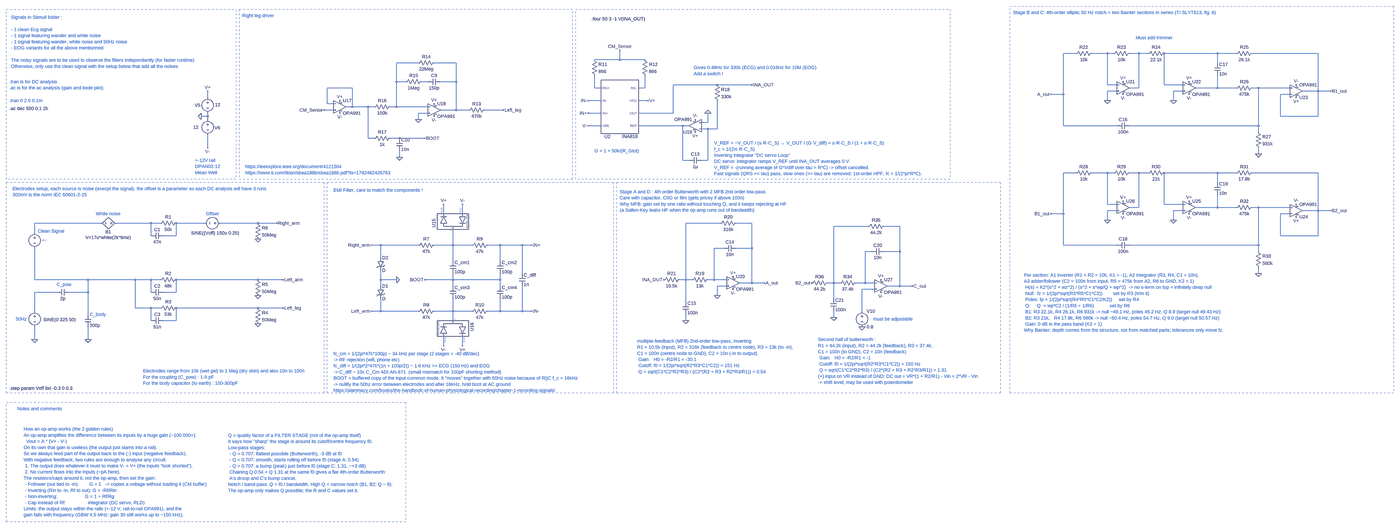
[diagram p0: schematic ECG-EOG_project.asc, whole sheet]
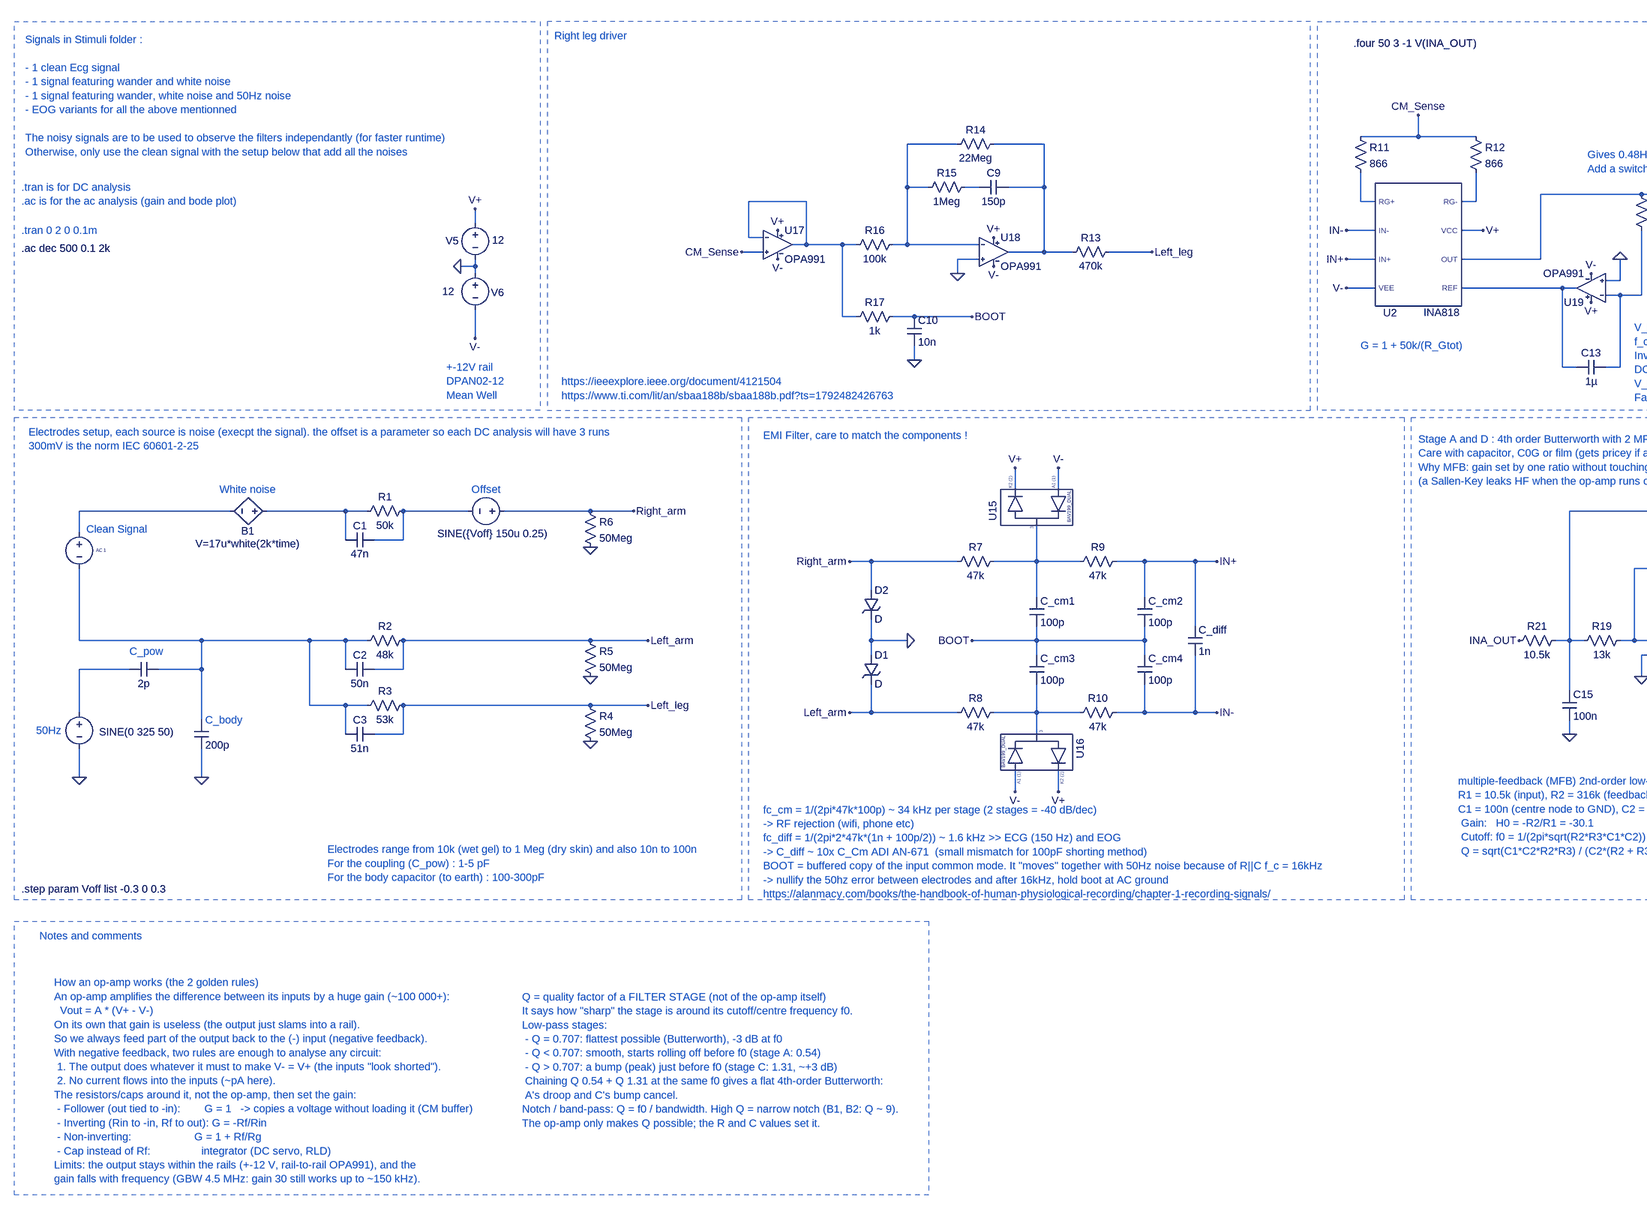
[diagram p1: schematic ECG-EOG_project.asc, part, row 1 of 1, column 1 of 2]
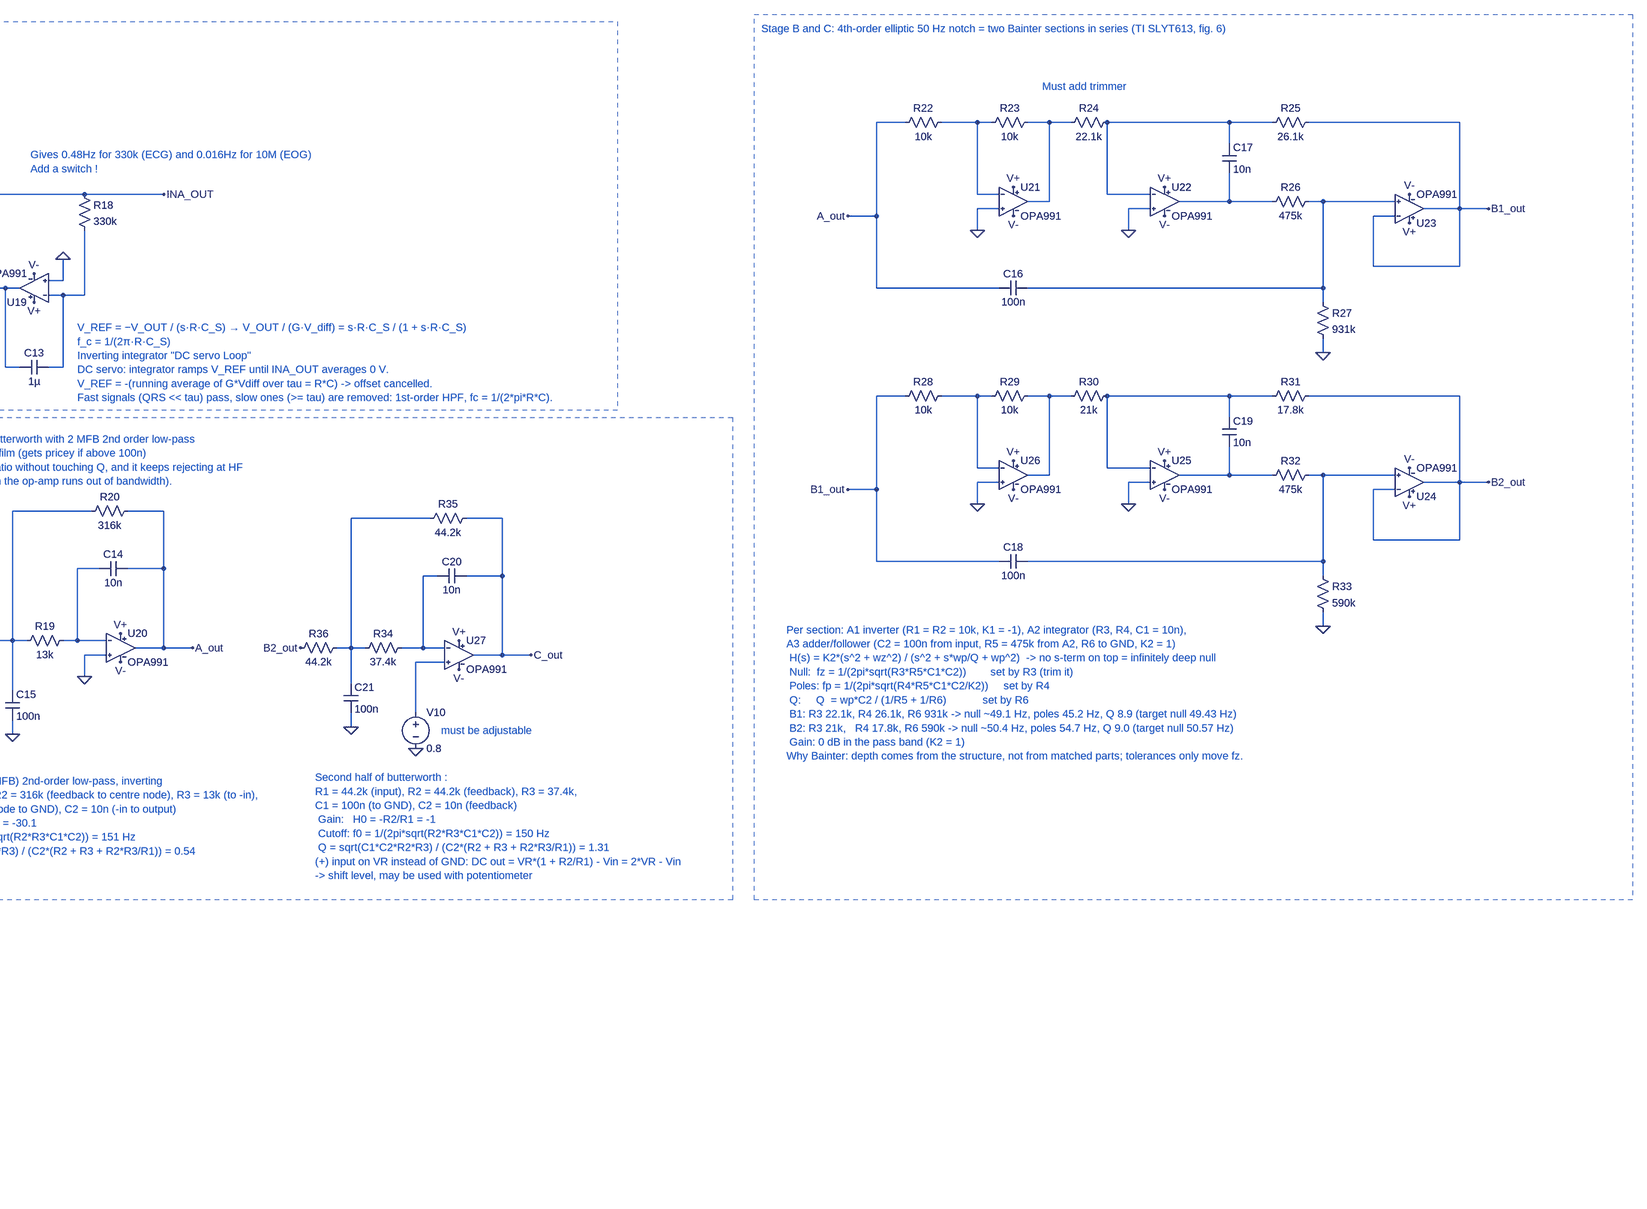
[diagram p2: schematic ECG-EOG_project.asc, part, row 1 of 1, column 2 of 2]
ECG-EOG_project.asc, the LTspice schematic file:
Version 4.1
SHEET 1 5588 1588
WIRE 3808 -800 3744 -800
WIRE 3968 -800 3888 -800
WIRE 4000 -800 3968 -800
WIRE 4128 -800 4080 -800
WIRE 4176 -800 4128 -800
WIRE 4528 -800 4256 -800
WIRE 4624 -800 4528 -800
WIRE 5040 -800 4704 -800
WIRE 1488 -768 1488 -816
WIRE 1488 -768 1360 -768
WIRE 1616 -768 1488 -768
WIRE 464 -752 352 -752
WIRE 656 -752 544 -752
WIRE 4528 -752 4528 -800
WIRE 352 -656 352 -752
WIRE 400 -656 352 -656
WIRE 512 -656 480 -656
WIRE 656 -656 656 -752
WIRE 656 -656 576 -656
WIRE 1984 -640 1760 -640
WIRE 2160 -640 1984 -640
WIRE 3968 -640 3968 -800
WIRE 4016 -640 3968 -640
WIRE 4256 -640 4256 -800
WIRE 4352 -640 4256 -640
WIRE 128 -624 0 -624
WIRE 1360 -624 1360 -688
WIRE 1392 -624 1360 -624
WIRE 1616 -624 1616 -688
WIRE 1616 -624 1584 -624
WIRE 4128 -624 4128 -800
WIRE 4128 -624 4080 -624
WIRE 4528 -624 4528 -688
WIRE 4528 -624 4416 -624
WIRE 4624 -624 4528 -624
WIRE 4736 -624 4704 -624
WIRE 4896 -624 4736 -624
WIRE 4016 -608 3968 -608
WIRE 4352 -608 4304 -608
WIRE 5040 -608 5040 -800
WIRE 5040 -608 4960 -608
WIRE 5104 -608 5040 -608
WIRE 3744 -592 3744 -800
WIRE 3744 -592 3680 -592
WIRE 4896 -592 4848 -592
WIRE -608 -576 -608 -608
WIRE 1392 -560 1328 -560
WIRE 1632 -560 1584 -560
WIRE 3968 -560 3968 -608
WIRE 4304 -560 4304 -608
WIRE 0 -544 0 -624
WIRE 32 -544 0 -544
WIRE 128 -528 128 -624
WIRE 128 -528 96 -528
WIRE 208 -528 128 -528
WIRE 240 -528 208 -528
WIRE 352 -528 352 -656
WIRE 352 -528 320 -528
WIRE 512 -528 352 -528
WIRE 32 -512 -16 -512
WIRE 656 -512 656 -656
WIRE 656 -512 576 -512
WIRE 720 -512 656 -512
WIRE 896 -512 800 -512
WIRE 512 -496 464 -496
WIRE 1392 -496 1328 -496
WIRE 1760 -496 1760 -640
WIRE 1760 -496 1584 -496
WIRE -608 -480 -608 -496
WIRE -608 -480 -640 -480
WIRE 4848 -480 4848 -592
WIRE 5040 -480 5040 -608
WIRE 5040 -480 4848 -480
WIRE -608 -464 -608 -480
WIRE 464 -464 464 -496
WIRE 1936 -448 1936 -496
WIRE 1936 -448 1904 -448
WIRE 1392 -432 1328 -432
WIRE 1808 -432 1584 -432
WIRE 1840 -432 1808 -432
WIRE 3744 -432 3744 -592
WIRE 4016 -432 3744 -432
WIRE 4736 -432 4736 -624
WIRE 4736 -432 4080 -432
WIRE 1936 -416 1904 -416
WIRE 1984 -416 1984 -560
WIRE 1984 -416 1936 -416
WIRE 4736 -400 4736 -432
WIRE 208 -368 208 -528
WIRE 240 -368 208 -368
WIRE 368 -368 320 -368
WIRE 496 -368 368 -368
WIRE -608 -320 -608 -384
WIRE 4736 -288 4736 -320
WIRE 368 -272 368 -304
WIRE 1808 -256 1808 -432
WIRE 1840 -256 1808 -256
WIRE 1936 -256 1936 -416
WIRE 1936 -256 1904 -256
WIRE 3808 -192 3744 -192
WIRE 3968 -192 3888 -192
WIRE 4000 -192 3968 -192
WIRE 4128 -192 4080 -192
WIRE 4176 -192 4128 -192
WIRE 4528 -192 4256 -192
WIRE 4624 -192 4528 -192
WIRE 5040 -192 4704 -192
WIRE 4528 -144 4528 -192
WIRE 3968 -32 3968 -192
WIRE 4016 -32 3968 -32
WIRE 4256 -32 4256 -192
WIRE 4352 -32 4256 -32
WIRE 4128 -16 4128 -192
WIRE 4128 -16 4080 -16
WIRE 4528 -16 4528 -80
WIRE 4528 -16 4416 -16
WIRE 4624 -16 4528 -16
WIRE 4736 -16 4704 -16
WIRE 4896 -16 4736 -16
WIRE 4016 0 3968 0
WIRE 4352 0 4304 0
WIRE 5040 0 5040 -192
WIRE 5040 0 4960 0
WIRE 5104 0 5040 0
WIRE 592 16 592 -32
WIRE 688 16 688 -32
WIRE 3744 16 3744 -192
WIRE 3744 16 3680 16
WIRE 4896 16 4848 16
WIRE 3968 48 3968 0
WIRE 4304 48 4304 0
WIRE -1152 64 -1488 64
WIRE -896 64 -1072 64
WIRE -848 64 -896 64
WIRE -624 64 -768 64
WIRE -352 64 -544 64
WIRE -256 64 -352 64
WIRE 2000 64 1824 64
WIRE 2160 64 2080 64
WIRE 2752 80 2576 80
WIRE 2912 80 2832 80
WIRE -1488 112 -1488 64
WIRE -896 128 -896 64
WIRE -768 128 -768 64
WIRE -768 128 -832 128
WIRE 4848 128 4848 16
WIRE 5040 128 5040 0
WIRE 5040 128 4848 128
WIRE 272 176 224 176
WIRE 464 176 272 176
WIRE 640 176 640 96
WIRE 640 176 544 176
WIRE 736 176 640 176
WIRE 880 176 816 176
WIRE 992 176 880 176
WIRE 1040 176 992 176
WIRE 3744 176 3744 16
WIRE 4016 176 3744 176
WIRE 4736 176 4736 -16
WIRE 4736 176 4080 176
WIRE 2016 192 1968 192
WIRE 2160 192 2160 64
WIRE 2160 192 2080 192
WIRE 2768 208 2736 208
WIRE 2912 208 2912 80
WIRE 2912 208 2832 208
WIRE 4736 208 4736 176
WIRE 272 240 272 176
WIRE 640 256 640 176
WIRE 880 256 880 176
WIRE 992 320 992 176
WIRE 4736 320 4736 288
WIRE -1488 352 -1488 192
WIRE -1216 352 -1488 352
WIRE -976 352 -1216 352
WIRE -896 352 -976 352
WIRE -848 352 -896 352
WIRE -352 352 -768 352
WIRE -224 352 -352 352
WIRE 272 352 272 304
WIRE 352 352 272 352
WIRE 640 352 640 320
WIRE 640 352 496 352
WIRE 880 352 880 320
WIRE 880 352 640 352
WIRE 1824 352 1824 64
WIRE 1824 352 1792 352
WIRE 1856 352 1824 352
WIRE 1968 352 1968 192
WIRE 1968 352 1936 352
WIRE 2032 352 1968 352
WIRE 2160 368 2160 192
WIRE 2160 368 2096 368
WIRE 2224 368 2160 368
WIRE 2576 368 2576 80
WIRE 2576 368 2544 368
WIRE 2608 368 2576 368
WIRE 2736 368 2736 208
WIRE 2736 368 2688 368
WIRE 2784 368 2736 368
WIRE 272 384 272 352
WIRE 640 384 640 352
WIRE 880 384 880 352
WIRE 2032 384 1984 384
WIRE 2912 384 2912 208
WIRE 2912 384 2848 384
WIRE 2976 384 2912 384
WIRE 2784 400 2720 400
WIRE -1376 416 -1488 416
WIRE -1216 416 -1216 352
WIRE -1216 416 -1312 416
WIRE -896 416 -896 352
WIRE -768 416 -768 352
WIRE -768 416 -832 416
WIRE 1984 432 1984 384
WIRE 2576 448 2576 368
WIRE 1824 464 1824 352
WIRE -976 496 -976 352
WIRE -896 496 -976 496
WIRE -848 496 -896 496
WIRE -352 496 -768 496
WIRE -224 496 -352 496
WIRE -1488 512 -1488 416
WIRE 272 512 272 448
WIRE 272 512 224 512
WIRE 464 512 272 512
WIRE 640 512 640 448
WIRE 640 512 544 512
WIRE 736 512 640 512
WIRE 880 512 880 448
WIRE 880 512 816 512
WIRE 992 512 992 384
WIRE 992 512 880 512
WIRE 1040 512 992 512
WIRE 2720 512 2720 400
WIRE -1216 528 -1216 416
WIRE 2576 544 2576 512
WIRE -896 560 -896 496
WIRE -768 560 -768 496
WIRE -768 560 -832 560
WIRE 640 560 640 512
WIRE 1824 560 1824 528
WIRE -1488 656 -1488 592
WIRE -1216 656 -1216 592
WIRE 592 688 592 640
WIRE 688 688 688 640
FLAG -256 64 Right_arm
FLAG -224 352 Left_arm
FLAG -224 496 Left_leg
FLAG -352 144 0
FLAG -352 432 0
FLAG -352 576 0
FLAG -640 -480 0
FLAG -608 -608 V+
FLAG -608 -320 V-
FLAG 352 352 0
FLAG 224 512 Left_arm
FLAG 224 176 Right_arm
FLAG 496 352 BOOT
FLAG 1040 176 IN+
FLAG 1040 512 IN-
FLAG 1328 -560 IN-
FLAG 1328 -496 IN+
FLAG 1632 -560 V+
FLAG 1328 -432 V-
FLAG 2160 -640 INA_OUT
FLAG 688 688 V+
FLAG 592 688 V-
FLAG 592 -32 V+
FLAG 688 -32 V-
FLAG 64 -560 V+
FLAG 64 -496 V-
FLAG 544 -544 V+
FLAG 544 -480 V-
FLAG 1488 -816 CM_Sense
FLAG -16 -512 CM_Sense
FLAG 896 -512 Left_leg
FLAG 464 -464 0
FLAG 496 -368 BOOT
FLAG 368 -272 0
FLAG -1488 656 0
FLAG -1216 656 0
FLAG 1872 -400 V+
FLAG 1872 -464 V-
FLAG 1936 -496 0
FLAG 2064 336 V+
FLAG 2064 400 V-
FLAG 1984 432 0
FLAG 1824 560 0
FLAG 4048 -656 V+
FLAG 4048 -592 V-
FLAG 3968 -560 0
FLAG 4384 -656 V+
FLAG 4384 -592 V-
FLAG 4304 -560 0
FLAG 4928 -576 V+
FLAG 4928 -640 V-
FLAG 4736 -288 0
FLAG 5104 -608 B1_out
FLAG 2224 368 A_out
FLAG 3680 -592 A_out
FLAG 4048 -48 V+
FLAG 4048 16 V-
FLAG 3968 48 0
FLAG 4384 -48 V+
FLAG 4384 16 V-
FLAG 4304 48 0
FLAG 4928 32 V+
FLAG 4928 -32 V-
FLAG 4736 320 0
FLAG 3680 16 B1_out
FLAG 5104 0 B2_out
FLAG 2816 352 V+
FLAG 2816 416 V-
FLAG 2576 544 0
FLAG 2976 384 C_out
FLAG 2464 368 B2_out
FLAG 2720 592 0
FLAG 1712 352 INA_OUT
SYMBOL res -752 48 R90
WINDOW 0 0 56 VBottom 2
WINDOW 3 32 56 VTop 2
SYMATTR InstName R1
SYMATTR Value 50k
SYMBOL cap -832 112 R90
WINDOW 0 0 32 VBottom 2
WINDOW 3 32 32 VTop 2
SYMATTR InstName C1
SYMATTR Value 47n
SYMBOL res -752 336 R90
WINDOW 0 0 56 VBottom 2
WINDOW 3 32 56 VTop 2
SYMATTR InstName R2
SYMATTR Value 48k
SYMBOL cap -832 400 R90
WINDOW 0 0 32 VBottom 2
WINDOW 3 32 32 VTop 2
SYMATTR InstName C2
SYMATTR Value 50n
SYMBOL res -752 480 R90
WINDOW 0 0 56 VBottom 2
WINDOW 3 32 56 VTop 2
SYMATTR InstName R3
SYMATTR Value 53k
SYMBOL cap -832 544 R90
WINDOW 0 0 32 VBottom 2
WINDOW 3 32 32 VTop 2
SYMATTR InstName C3
SYMATTR Value 51n
SYMBOL res -368 480 R0
SYMATTR InstName R4
SYMATTR Value 50Meg
SYMBOL res -368 336 R0
SYMATTR InstName R5
SYMATTR Value 50Meg
SYMBOL res -368 48 R0
SYMATTR InstName R6
SYMATTR Value 50Meg
SYMBOL voltage -608 -592 R0
WINDOW 0 -66 55 Left 2
WINDOW 3 38 54 Left 2
WINDOW 123 0 0 Left 0
WINDOW 39 0 0 Left 0
SYMATTR InstName V5
SYMATTR Value 12
SYMBOL voltage -608 -480 R0
WINDOW 0 35 58 Left 2
WINDOW 3 -73 56 Left 2
WINDOW 123 0 0 Left 0
WINDOW 39 0 0 Left 0
SYMATTR InstName V6
SYMATTR Value 12
SYMBOL res 560 160 R90
WINDOW 0 0 56 VBottom 2
WINDOW 3 32 56 VTop 2
SYMATTR InstName R7
SYMATTR Value 47k
SYMATTR SpiceLine tol=1
SYMBOL res 560 496 R90
WINDOW 0 0 56 VBottom 2
WINDOW 3 32 56 VTop 2
SYMATTR InstName R8
SYMATTR Value 47k
SYMATTR SpiceLine tol=1
SYMBOL TVSdiode 256 384 R0
SYMATTR InstName D1
SYMBOL TVSdiode 256 240 R0
SYMATTR InstName D2
SYMBOL res 832 160 R90
WINDOW 0 0 56 VBottom 2
WINDOW 3 32 56 VTop 2
SYMATTR InstName R9
SYMATTR Value 47k
SYMATTR SpiceLine tol=1
SYMBOL res 832 496 R90
WINDOW 0 0 56 VBottom 2
WINDOW 3 32 56 VTop 2
SYMATTR InstName R10
SYMATTR Value 47k
SYMATTR SpiceLine tol=1
SYMBOL cap 624 256 R0
SYMATTR InstName C_cm1
SYMATTR Value 100p
SYMBOL res 1344 -784 R0
SYMATTR InstName R11
SYMATTR Value 866
SYMATTR SpiceLine tol=1
SYMBOL cap 976 320 R0
SYMATTR InstName C_diff
SYMATTR Value 1n
SYMBOL res 1600 -784 R0
SYMATTR InstName R12
SYMATTR Value 866
SYMATTR SpiceLine tol=1
SYMBOL res 816 -528 R90
WINDOW 0 0 56 VBottom 2
WINDOW 3 32 56 VTop 2
SYMATTR InstName R13
SYMATTR Value 470k
SYMATTR SpiceLine tol=1
SYMBOL cap 576 -672 R90
WINDOW 0 0 32 VBottom 2
WINDOW 3 32 32 VTop 2
SYMATTR InstName C9
SYMATTR Value 150p
SYMBOL res 560 -768 R90
WINDOW 0 0 56 VBottom 2
WINDOW 3 32 56 VTop 2
SYMATTR InstName R14
SYMATTR Value 22Meg
SYMBOL res 496 -672 R90
WINDOW 0 0 56 VBottom 2
WINDOW 3 32 56 VTop 2
SYMATTR InstName R15
SYMATTR Value 1Meg
SYMBOL res 336 -544 R90
WINDOW 0 0 56 VBottom 2
WINDOW 3 32 56 VTop 2
SYMATTR InstName R16
SYMATTR Value 100k
SYMBOL res 336 -384 R90
WINDOW 0 0 56 VBottom 2
WINDOW 3 32 56 VTop 2
SYMATTR InstName R17
SYMATTR Value 1k
SYMBOL cap 352 -368 R0
SYMATTR InstName C10
SYMATTR Value 10n
SYMBOL voltage -528 64 R90
WINDOW 0 46 40 Invisible 2
WINDOW 3 50 -82 VRight 2
SYMATTR InstName V4
SYMATTR Value SINE({Voff} 150u 0.25)
SYMBOL bv -1056 64 R90
WINDOW 0 60 57 VBottom 2
WINDOW 3 88 57 VBottom 2
SYMATTR InstName B1
SYMATTR Value V=17u*white(2k*time)
SYMBOL voltage -1488 496 R0
WINDOW 0 -66 54 Invisible 2
WINDOW 3 44 59 Left 2
SYMATTR InstName V7
SYMATTR Value SINE(0 325 50)
SYMBOL cap -1312 400 R90
WINDOW 0 0 32 Invisible 2
WINDOW 3 32 32 VTop 2
SYMATTR InstName C11
SYMATTR Value 2p
SYMBOL cap -1232 528 R0
WINDOW 0 24 8 Invisible 2
SYMATTR InstName C12
SYMATTR Value 200p
SYMBOL voltage -1488 96 R0
WINDOW 3 24 96 Invisible 2
WINDOW 0 24 16 Invisible 2
WINDOW 123 38 56 Left 0
WINDOW 39 0 0 Left 0
SYMATTR Value PWL file=C:\Users\thoma\Documents\Uliege\Bioelectronics\GBIO0029-ECG-FrontEnd\LTspice\stimuli\ecg_clean.txt
SYMATTR InstName V8
SYMATTR Value2 AC 1
SYMBOL INA818 1488 -464 R0
SYMATTR InstName U2
SYMBOL res 1968 -656 R0
SYMATTR InstName R18
SYMATTR Value 330k
SYMBOL cap 1904 -272 R90
WINDOW 0 0 32 VBottom 2
WINDOW 3 32 32 VTop 2
SYMATTR InstName C13
SYMATTR Value 1µ
SYMBOL cap 2080 176 R90
WINDOW 0 0 32 VBottom 2
WINDOW 3 32 32 VTop 2
SYMATTR InstName C14
SYMATTR Value 10n
SYMBOL res 1952 336 R90
WINDOW 0 0 56 VBottom 2
WINDOW 3 32 56 VTop 2
SYMATTR InstName R19
SYMATTR Value 13k
SYMBOL res 2096 48 R90
WINDOW 0 0 56 VBottom 2
WINDOW 3 32 56 VTop 2
SYMATTR InstName R20
SYMATTR Value 316k
SYMBOL res 1808 336 R90
WINDOW 0 0 56 VBottom 2
WINDOW 3 32 56 VTop 2
SYMATTR InstName R21
SYMATTR Value 10.5k
SYMBOL cap 1808 464 R0
SYMATTR InstName C15
SYMATTR Value 100n
SYMBOL res 3904 -816 R90
WINDOW 0 0 56 VBottom 2
WINDOW 3 32 56 VTop 2
SYMATTR InstName R22
SYMATTR Value 10k
SYMBOL res 4096 -816 R90
WINDOW 0 0 56 VBottom 2
WINDOW 3 32 56 VTop 2
SYMATTR InstName R23
SYMATTR Value 10k
SYMBOL res 4272 -816 R90
WINDOW 0 0 56 VBottom 2
WINDOW 3 32 56 VTop 2
SYMATTR InstName R24
SYMATTR Value 22.1k
SYMBOL cap 4080 -448 R90
WINDOW 0 0 32 VBottom 2
WINDOW 3 32 32 VTop 2
SYMATTR InstName C16
SYMATTR Value 100n
SYMBOL cap 4512 -752 R0
SYMATTR InstName C17
SYMATTR Value 10n
SYMBOL res 4720 -816 R90
WINDOW 0 0 56 VBottom 2
WINDOW 3 32 56 VTop 2
SYMATTR InstName R25
SYMATTR Value 26.1k
SYMBOL res 4720 -640 R90
WINDOW 0 0 56 VBottom 2
WINDOW 3 32 56 VTop 2
SYMATTR InstName R26
SYMATTR Value 475k
SYMBOL res 4720 -416 R0
SYMATTR InstName R27
SYMATTR Value 931k
SYMBOL res 3904 -208 R90
WINDOW 0 0 56 VBottom 2
WINDOW 3 32 56 VTop 2
SYMATTR InstName R28
SYMATTR Value 10k
SYMBOL res 4096 -208 R90
WINDOW 0 0 56 VBottom 2
WINDOW 3 32 56 VTop 2
SYMATTR InstName R29
SYMATTR Value 10k
SYMBOL res 4272 -208 R90
WINDOW 0 0 56 VBottom 2
WINDOW 3 32 56 VTop 2
SYMATTR InstName R30
SYMATTR Value 21k
SYMBOL cap 4080 160 R90
WINDOW 0 0 32 VBottom 2
WINDOW 3 32 32 VTop 2
SYMATTR InstName C18
SYMATTR Value 100n
SYMBOL cap 4512 -144 R0
SYMATTR InstName C19
SYMATTR Value 10n
SYMBOL res 4720 -208 R90
WINDOW 0 0 56 VBottom 2
WINDOW 3 32 56 VTop 2
SYMATTR InstName R31
SYMATTR Value 17.8k
SYMBOL res 4720 -32 R90
WINDOW 0 0 56 VBottom 2
WINDOW 3 32 56 VTop 2
SYMATTR InstName R32
SYMATTR Value 475k
SYMBOL res 4720 192 R0
SYMATTR InstName R33
SYMATTR Value 590k
SYMBOL cap 2832 192 R90
WINDOW 0 0 32 VBottom 2
WINDOW 3 32 32 VTop 2
SYMATTR InstName C20
SYMATTR Value 10n
SYMBOL res 2704 352 R90
WINDOW 0 0 56 VBottom 2
WINDOW 3 32 56 VTop 2
SYMATTR InstName R34
SYMATTR Value 37.4k
SYMBOL res 2848 64 R90
WINDOW 0 0 56 VBottom 2
WINDOW 3 32 56 VTop 2
SYMATTR InstName R35
SYMATTR Value 44.2k
SYMBOL res 2560 352 R90
WINDOW 0 0 56 VBottom 2
WINDOW 3 32 56 VTop 2
SYMATTR InstName R36
SYMATTR Value 44.2k
SYMBOL cap 2560 448 R0
SYMATTR InstName C21
SYMATTR Value 100n
SYMBOL voltage 2720 496 R0
WINDOW 123 0 0 Left 0
WINDOW 39 0 0 Left 0
SYMATTR InstName V10
SYMATTR Value 0.8
SYMBOL cap 864 256 R0
SYMATTR InstName C_cm2
SYMATTR Value 100p
SYMBOL cap 624 384 R0
SYMATTR InstName C_cm3
SYMATTR Value 100p
SYMBOL cap 864 384 R0
SYMATTR InstName C_cm4
SYMATTR Value 100p
SYMBOL Models\\BAV199\\BAV199_DUAL 592 80 R270
SYMATTR InstName U15
SYMBOL Models\\BAV199\\BAV199_DUAL 688 576 R90
SYMATTR InstName U16
SYMBOL Models\\OPA991\\OPA991 64 -592 R0
SYMATTR InstName U17
SYMBOL Models\\OPA991\\OPA991 544 -576 R0
SYMATTR InstName U18
SYMBOL Models\\OPA991\\OPA991 1872 -368 R180
SYMATTR InstName U19
SYMBOL Models\\OPA991\\OPA991 2064 304 R0
SYMATTR InstName U20
SYMBOL Models\\OPA991\\OPA991 4048 -688 R0
SYMATTR InstName U21
SYMBOL Models\\OPA991\\OPA991 4384 -688 R0
SYMATTR InstName U22
SYMBOL Models\\OPA991\\OPA991 4928 -544 M180
SYMATTR InstName U23
SYMBOL Models\\OPA991\\OPA991 4928 64 M180
SYMATTR InstName U24
SYMBOL Models\\OPA991\\OPA991 4384 -80 R0
SYMATTR InstName U25
SYMBOL Models\\OPA991\\OPA991 4048 -80 R0
SYMATTR InstName U26
SYMBOL Models\\OPA991\\OPA991 2816 320 R0
SYMATTR InstName U27
TEXT -1608 -984 Left 2 ;Signals in Stimuli folder : \n \n- 1 clean Ecg signal\n- 1 signal featuring wander and white noise \n- 1 signal featuring wander, white noise and 50Hz noise\n- EOG variants for all the above mentionned\n \nThe noisy signals are to be used to observe the filters independantly (for faster runtime)\nOtherwise, only use the clean signal with the setup below that add all the noises
TEXT -1616 -560 Left 2 ;.tran 0 2 0 0.1m
TEXT -1600 -112 Left 2 ;Electrodes setup, each source is noise (execpt the signal). the offset is a parameter so each DC analysis will have 3 runs\n300mV is the norm IEC 60601-2-25
TEXT -672 -256 Left 2 ;+-12V rail\nDPAN02-12 \nMean Well
TEXT 32 -104 Left 2 ;EMI Filter, care to match the components !
TEXT 1360 -304 Left 2 ;G = 1 + 50k/(R_Gtot)
TEXT -1616 904 Left 2 !.step param Voff list -0.3 0 0.3
TEXT -616 16 Left 2 ;Offset
TEXT -1176 16 Left 2 ;White noise
TEXT -1208 528 Left 2 ;C_body
TEXT -1376 376 Left 2 ;C_pow
TEXT -1472 104 Left 2 ;Clean Signal
TEXT -1584 552 Left 2 ;50Hz
TEXT 1344 -976 Left 2 !.four 50 3 -1 V(INA_OUT)
TEXT -432 -992 Left 2 ;Right leg driver
TEXT 1864 -728 Left 2 ;Gives 0.48Hz for 330k (ECG) and 0.016Hz for 10M (EOG)\nAdd a switch !
TEXT 1968 -344 Left 2 ;V_REF = −V_OUT / (s·R·C_S) → V_OUT / (G·V_diff) = s·R·C_S / (1 + s·R·C_S)\nf_c = 1/(2π·R·C_S)\nInverting integrator "DC servo Loop"\nDC servo: integrator ramps V_REF until INA_OUT averages 0 V.\nV_REF = -(running average of G*Vdiff over tau = R*C) -> offset cancelled.\nFast signals (QRS << tau) pass, slow ones (>= tau) are removed: 1st-order HPF, fc = 1/(2*pi*R*C).
TEXT 4112 -880 Left 2 ;Must add trimmer
TEXT -1616 -520 Left 2 !.ac dec 500 0.1 2k
TEXT -1616 -656 Left 2 ;.tran is for DC analysis\n.ac is for the ac analysis (gain and bode plot)
TEXT -936 816 Left 2 ;Electrodes range from 10k (wet gel) to 1 Meg (dry skin) and also 10n to 100n\nFor the coupling (C_pow) : 1-5 pF\nFor the body capacitor (to earth) : 100-300pF
TEXT 32 728 Left 2 ;fc_cm = 1/(2pi*47k*100p) ~ 34 kHz per stage (2 stages = -40 dB/dec)\n-> RF rejection (wifi, phone etc) \nfc_diff = 1/(2pi*2*47k*(1n + 100p/2)) ~ 1.6 kHz >> ECG (150 Hz) and EOG\n-> C_diff ~ 10x C_Cm ADI AN-671  (small mismatch for 100pF shorting method)\nBOOT = buffered copy of the input common mode. It "moves" together with 50Hz noise because of R||C f_c = 16kHz\n-> nullify the 50hz error between electrodes and after 16kHz, hold boot at AC ground\nhttps://alanmacy.com/books/the-handbook-of-human-physiological-recording/chapter-1-recording-signals/
TEXT -416 -224 Left 2 ;https://ieeexplore.ieee.org/document/4121504\nhttps://www.ti.com/lit/an/sbaa188b/sbaa188b.pdf?ts=1792482426763
TEXT 1488 -96 Left 2 ;Stage A and D : 4th order Butterworth with 2 MFB 2nd order low-pass\nCare with capacitor, C0G or film (gets pricey if above 100n)\nWhy MFB: gain set by one ratio without touching Q, and it keeps rejecting at HF\n(a Sallen-Key leaks HF when the op-amp runs out of bandwidth).
TEXT 2776 552 Left 2 ;must be adjustable
TEXT 1576 664 Left 2 ;multiple-feedback (MFB) 2nd-order low-pass, inverting\nR1 = 10.5k (input), R2 = 316k (feedback to centre node), R3 = 13k (to -in),\nC1 = 100n (centre node to GND), C2 = 10n (-in to output)\n Gain:   H0 = -R2/R1 = -30.1\n Cutoff: f0 = 1/(2pi*sqrt(R2*R3*C1*C2)) = 151 Hz\n Q = sqrt(C1*C2*R2*R3) / (C2*(R2 + R3 + R2*R3/R1)) = 0.54
TEXT 2496 656 Left 2 ;Second half of butterworth :\nR1 = 44.2k (input), R2 = 44.2k (feedback), R3 = 37.4k, \nC1 = 100n (to GND), C2 = 10n (feedback)\n Gain:   H0 = -R2/R1 = -1\n Cutoff: f0 = 1/(2pi*sqrt(R2*R3*C1*C2)) = 150 Hz\n Q = sqrt(C1*C2*R2*R3) / (C2*(R2 + R3 + R2*R3/R1)) = 1.31\n(+) input on VR instead of GND: DC out = VR*(1 + R2/R1) - Vin = 2*VR - Vin\n-> shift level, may be used with potentiometer
TEXT 3488 -1008 Left 2 ;Stage B and C: 4th-order elliptic 50 Hz notch = two Bainter sections in series (TI SLYT613, fig. 6)
TEXT 3544 328 Left 2 ;Per section: A1 inverter (R1 = R2 = 10k, K1 = -1), A2 integrator (R3, R4, C1 = 10n),\nA3 adder/follower (C2 = 100n from input, R5 = 475k from A2, R6 to GND, K2 = 1)\n H(s) = K2*(s^2 + wz^2) / (s^2 + s*wp/Q + wp^2)  -> no s-term on top = infinitely deep null\n Null:  fz = 1/(2pi*sqrt(R3*R5*C1*C2))        set by R3 (trim it)\n Poles: fp = 1/(2pi*sqrt(R4*R5*C1*C2/K2))     set by R4\n Q:     Q  = wp*C2 / (1/R5 + 1/R6)            set by R6\n B1: R3 22.1k, R4 26.1k, R6 931k -> null ~49.1 Hz, poles 45.2 Hz, Q 8.9 (target null 49.43 Hz)\n B2: R3 21k,   R4 17.8k, R6 590k -> null ~50.4 Hz, poles 54.7 Hz, Q 9.0 (target null 50.57 Hz)\n Gain: 0 dB in the pass band (K2 = 1)\nWhy Bainter: depth comes from the structure, not from matched parts; tolerances only move fz.
TEXT -1544 1112 Left 2 ;How an op-amp works (the 2 golden rules)\nAn op-amp amplifies the difference between its inputs by a huge gain (~100 000+):\n  Vout = A * (V+ - V-)\nOn its own that gain is useless (the output just slams into a rail).\nSo we always feed part of the output back to the (-) input (negative feedback).\nWith negative feedback, two rules are enough to analyse any circuit:\n 1. The output does whatever it must to make V- = V+ (the inputs "look shorted").\n 2. No current flows into the inputs (~pA here).\nThe resistors/caps around it, not the op-amp, then set the gain:\n - Follower (out tied to -in):        G = 1   -> copies a voltage without loading it (CM buffer)\n - Inverting (Rin to -in, Rf to out): G = -Rf/Rin\n - Non-inverting:                     G = 1 + Rf/Rg\n - Cap instead of Rf:                 integrator (DC servo, RLD)\nLimits: the output stays within the rails (+-12 V, rail-to-rail OPA991), and the\ngain falls with frequency (GBW 4.5 MHz: gain 30 still works up to ~150 kHz).
TEXT -504 1144 Left 2 ;Q = quality factor of a FILTER STAGE (not of the op-amp itself)\nIt says how "sharp" the stage is around its cutoff/centre frequency f0.\nLow-pass stages:\n - Q = 0.707: flattest possible (Butterworth), -3 dB at f0\n - Q < 0.707: smooth, starts rolling off before f0 (stage A: 0.54)\n - Q > 0.707: a bump (peak) just before f0 (stage C: 1.31, ~+3 dB)\n Chaining Q 0.54 + Q 1.31 at the same f0 gives a flat 4th-order Butterworth:\n A's droop and C's bump cancel.\nNotch / band-pass: Q = f0 / bandwidth. High Q = narrow notch (B1, B2: Q ~ 9).\nThe op-amp only makes Q possible; the R and C values set it.
TEXT -1576 1008 Left 2 ;Notes and comments
RECTANGLE Normal -464 -160 -1632 -1024 1
RECTANGLE Normal -16 928 -1632 -144 1
RECTANGLE Normal 1456 928 0 -144 1
RECTANGLE Normal 1248 -1024 -448 -160 1
RECTANGLE Normal 3168 -160 1264 -1024 1
RECTANGLE Normal 3424 928 1472 -144 1
RECTANGLE Normal 5424 928 3472 -1040 1
RECTANGLE Normal 400 1584 -1632 976 1

The netlist it stands for:
* ECG-EOG_project.asc
R1 N021 N020 50k
C1 N021 N020 47n
R2 Left_arm N027 48k
C2 Left_arm N027 50n
R3 Left_leg N027 53k
C3 Left_leg N027 51n
R4 Left_leg 0 50Meg
R5 Left_arm 0 50Meg
R6 Right_arm 0 50Meg
V5 V+ 0 12
V6 0 V- 12
R7 N024 Right_arm 47k tol=1
R8 N030 Left_arm 47k tol=1
D1 0 Left_arm D
D2 Right_arm 0 D
R9 IN+ N024 47k tol=1
R10 IN- N030 47k tol=1
C_cm1 N024 BOOT 100p
R11 CM_Sense N008 866 tol=1
C_diff IN+ IN- 1n
R12 CM_Sense N009 866 tol=1
R13 Left_leg N005 470k tol=1
C9 N005 N006 150p
R14 N005 N004 22Meg
R15 N006 N004 1Meg
R16 N004 N007 100k
R17 BOOT N007 1k
C10 BOOT 0 10n
V4 Right_arm N021 SINE({Voff} 150u 0.25)
B1 N020 N019 V=17u*white(2k*time)
V7 N029 0 SINE(0 325 50)
C11 N027 N029 2p
C12 N027 0 200p
V8 N019 N027 PWL file=C:\Users\thoma\Documents\Uliege\Bioelectronics\GBIO0029-ECG-FrontEnd\LTspice\stimuli\ecg_clean.txt AC 1
X§U2 IN+ IN- V+ V- INA_OUT N012 N008 N009 INA818  ; pins IN+ IN- VCC VEE OUT REF RG+ RG-
R18 INA_OUT N013 330k
C13 N013 N012 1µ
C14 A_out N025 10n
R19 N025 N022 13k
R20 A_out N022 316k
R21 N022 INA_OUT 10.5k
C15 N022 0 100n
R22 N001 A_out 10k
R23 N002 N001 10k
R24 N003 N002 22.1k
C16 N011 A_out 100n
C17 N003 N010 10n
R25 B1_out N003 26.1k
R26 N011 N010 475k
R27 N011 0 931k
R28 N014 B1_out 10k
R29 N015 N014 10k
R30 N016 N015 21k
C18 N018 B1_out 100n
C19 N016 N017 10n
R31 B2_out N016 17.8k
R32 N018 N017 475k
R33 N018 0 590k
C20 C_out N026 10n
R34 N026 N023 37.4k
R35 C_out N023 44.2k
R36 N023 B2_out 44.2k
C21 N023 0 100n
V10 N028 0 0.8
C_cm2 IN+ BOOT 100p
C_cm3 BOOT N030 100p
C_cm4 BOOT IN- 100p
X§U15 V- V+ N024 BAV199_DUAL  ; pins A1 K2 MID
X§U16 V- V+ N030 BAV199_DUAL  ; pins A1 K2 MID
X§U17 CM_Sense N007 V+ V- N007 OPA991  ; pins In+ In- V+ V- OUT
X§U18 0 N004 V+ V- N005 OPA991  ; pins In+ In- V+ V- OUT
X§U19 0 N013 V+ V- N012 OPA991  ; pins In+ In- V+ V- OUT
X§U20 0 N025 V+ V- A_out OPA991  ; pins In+ In- V+ V- OUT
X§U21 0 N001 V+ V- N002 OPA991  ; pins In+ In- V+ V- OUT
X§U22 0 N003 V+ V- N010 OPA991  ; pins In+ In- V+ V- OUT
X§U23 N011 B1_out V+ V- B1_out OPA991  ; pins In+ In- V+ V- OUT
X§U24 N018 B2_out V+ V- B2_out OPA991  ; pins In+ In- V+ V- OUT
X§U25 0 N016 V+ V- N017 OPA991  ; pins In+ In- V+ V- OUT
X§U26 0 N014 V+ V- N015 OPA991  ; pins In+ In- V+ V- OUT
X§U27 N028 N026 V+ V- C_out OPA991  ; pins In+ In- V+ V- OUT
.model D D
.lib standard.dio
* Signals in Stimuli folder :
* - 1 clean Ecg signal
* - 1 signal featuring wander and white noise
* - 1 signal featuring wander, white noise and 50Hz noise
* - EOG variants for all the above mentionned
* The noisy signals are to be used to observe the filters independantly (for faster runtime)
* Otherwise, only use the clean signal with the setup below that add all the noises
* .tran 0 2 0 0.1m
* Electrodes setup, each source is noise (execpt the signal). the offset is a parameter so each DC analysis will have 3 runs
* 300mV is the norm IEC 60601-2-25
* +-12V rail
* DPAN02-12
* Mean Well
* EMI Filter, care to match the components !
* G = 1 + 50k/(R_Gtot)
.step param Voff list -0.3 0 0.3
* Offset
* White noise
* C_body
* C_pow
* Clean Signal
* 50Hz
.four 50 3 -1 V(INA_OUT)
* Right leg driver
* Gives 0.48Hz for 330k (ECG) and 0.016Hz for 10M (EOG)
* Add a switch !
* V_REF = −V_OUT / (s·R·C_S) → V_OUT / (G·V_diff) = s·R·C_S / (1 + s·R·C_S)
* f_c = 1/(2π·R·C_S)
* Inverting integrator "DC servo Loop"
* DC servo: integrator ramps V_REF until INA_OUT averages 0 V.
* V_REF = -(running average of G*Vdiff over tau = R*C) -> offset cancelled.
* Fast signals (QRS << tau) pass, slow ones (>= tau) are removed: 1st-order HPF, fc = 1/(2*pi*R*C).
* Must add trimmer
.ac dec 500 0.1 2k
* .tran is for DC analysis
* .ac is for the ac analysis (gain and bode plot)
* Electrodes range from 10k (wet gel) to 1 Meg (dry skin) and also 10n to 100n
* For the coupling (C_pow) : 1-5 pF
* For the body capacitor (to earth) : 100-300pF
* fc_cm = 1/(2pi*47k*100p) ~ 34 kHz per stage (2 stages = -40 dB/dec)
* -> RF rejection (wifi, phone etc)
* fc_diff = 1/(2pi*2*47k*(1n + 100p/2)) ~ 1.6 kHz >> ECG (150 Hz) and EOG
* -> C_diff ~ 10x C_Cm ADI AN-671  (small mismatch for 100pF shorting method)
* BOOT = buffered copy of the input common mode. It "moves" together with 50Hz noise because of R||C f_c = 16kHz
* -> nullify the 50hz error between electrodes and after 16kHz, hold boot at AC ground
* https://alanmacy.com/books/the-handbook-of-human-physiological-recording/chapter-1-recording-signals/
* https://ieeexplore.ieee.org/document/4121504
* https://www.ti.com/lit/an/sbaa188b/sbaa188b.pdf?ts=1792482426763
* Stage A and D : 4th order Butterworth with 2 MFB 2nd order low-pass
* Care with capacitor, C0G or film (gets pricey if above 100n)
* Why MFB: gain set by one ratio without touching Q, and it keeps rejecting at HF
* (a Sallen-Key leaks HF when the op-amp runs out of bandwidth).
* must be adjustable
* multiple-feedback (MFB) 2nd-order low-pass, inverting
* R1 = 10.5k (input), R2 = 316k (feedback to centre node), R3 = 13k (to -in),
* C1 = 100n (centre node to GND), C2 = 10n (-in to output)
*  Gain:   H0 = -R2/R1 = -30.1
*  Cutoff: f0 = 1/(2pi*sqrt(R2*R3*C1*C2)) = 151 Hz
*  Q = sqrt(C1*C2*R2*R3) / (C2*(R2 + R3 + R2*R3/R1)) = 0.54
* Second half of butterworth :
* R1 = 44.2k (input), R2 = 44.2k (feedback), R3 = 37.4k,
* C1 = 100n (to GND), C2 = 10n (feedback)
*  Gain:   H0 = -R2/R1 = -1
*  Cutoff: f0 = 1/(2pi*sqrt(R2*R3*C1*C2)) = 150 Hz
*  Q = sqrt(C1*C2*R2*R3) / (C2*(R2 + R3 + R2*R3/R1)) = 1.31
* (+) input on VR instead of GND: DC out = VR*(1 + R2/R1) - Vin = 2*VR - Vin
* -> shift level, may be used with potentiometer
* Stage B and C: 4th-order elliptic 50 Hz notch = two Bainter sections in series (TI SLYT613, fig. 6)
* Per section: A1 inverter (R1 = R2 = 10k, K1 = -1), A2 integrator (R3, R4, C1 = 10n),
* A3 adder/follower (C2 = 100n from input, R5 = 475k from A2, R6 to GND, K2 = 1)
*  H(s) = K2*(s^2 + wz^2) / (s^2 + s*wp/Q + wp^2)  -> no s-term on top = infinitely deep null
*  Null:  fz = 1/(2pi*sqrt(R3*R5*C1*C2))        set by R3 (trim it)
*  Poles: fp = 1/(2pi*sqrt(R4*R5*C1*C2/K2))     set by R4
*  Q:     Q  = wp*C2 / (1/R5 + 1/R6)            set by R6
*  B1: R3 22.1k, R4 26.1k, R6 931k -> null ~49.1 Hz, poles 45.2 Hz, Q 8.9 (target null 49.43 Hz)
*  B2: R3 21k,   R4 17.8k, R6 590k -> null ~50.4 Hz, poles 54.7 Hz, Q 9.0 (target null 50.57 Hz)
*  Gain: 0 dB in the pass band (K2 = 1)
* Why Bainter: depth comes from the structure, not from matched parts; tolerances only move fz.
* How an op-amp works (the 2 golden rules)
* An op-amp amplifies the difference between its inputs by a huge gain (~100 000+):
*   Vout = A * (V+ - V-)
* On its own that gain is useless (the output just slams into a rail).
* So we always feed part of the output back to the (-) input (negative feedback).
* With negative feedback, two rules are enough to analyse any circuit:
*  1. The output does whatever it must to make V- = V+ (the inputs "look shorted").
*  2. No current flows into the inputs (~pA here).
* The resistors/caps around it, not the op-amp, then set the gain:
*  - Follower (out tied to -in):        G = 1   -> copies a voltage without loading it (CM buffer)
*  - Inverting (Rin to -in, Rf to out): G = -Rf/Rin
*  - Non-inverting:                     G = 1 + Rf/Rg
*  - Cap instead of Rf:                 integrator (DC servo, RLD)
* Limits: the output stays within the rails (+-12 V, rail-to-rail OPA991), and the
* gain falls with frequency (GBW 4.5 MHz: gain 30 still works up to ~150 kHz).
* Q = quality factor of a FILTER STAGE (not of the op-amp itself)
* It says how "sharp" the stage is around its cutoff/centre frequency f0.
* Low-pass stages:
*  - Q = 0.707: flattest possible (Butterworth), -3 dB at f0
*  - Q < 0.707: smooth, starts rolling off before f0 (stage A: 0.54)
*  - Q > 0.707: a bump (peak) just before f0 (stage C: 1.31, ~+3 dB)
*  Chaining Q 0.54 + Q 1.31 at the same f0 gives a flat 4th-order Butterworth:
*  A's droop and C's bump cancel.
* Notch / band-pass: Q = f0 / bandwidth. High Q = narrow notch (B1, B2: Q ~ 9).
* The op-amp only makes Q possible; the R and C values set it.
* Notes and comments
.lib INA818.LIB
.lib BAV199.lib
.lib OPA991.lib
.backanno
.end